# EasyEDA Pro project ProPrj_ai交互控制系统_2026-10-29.epro, board PCB1
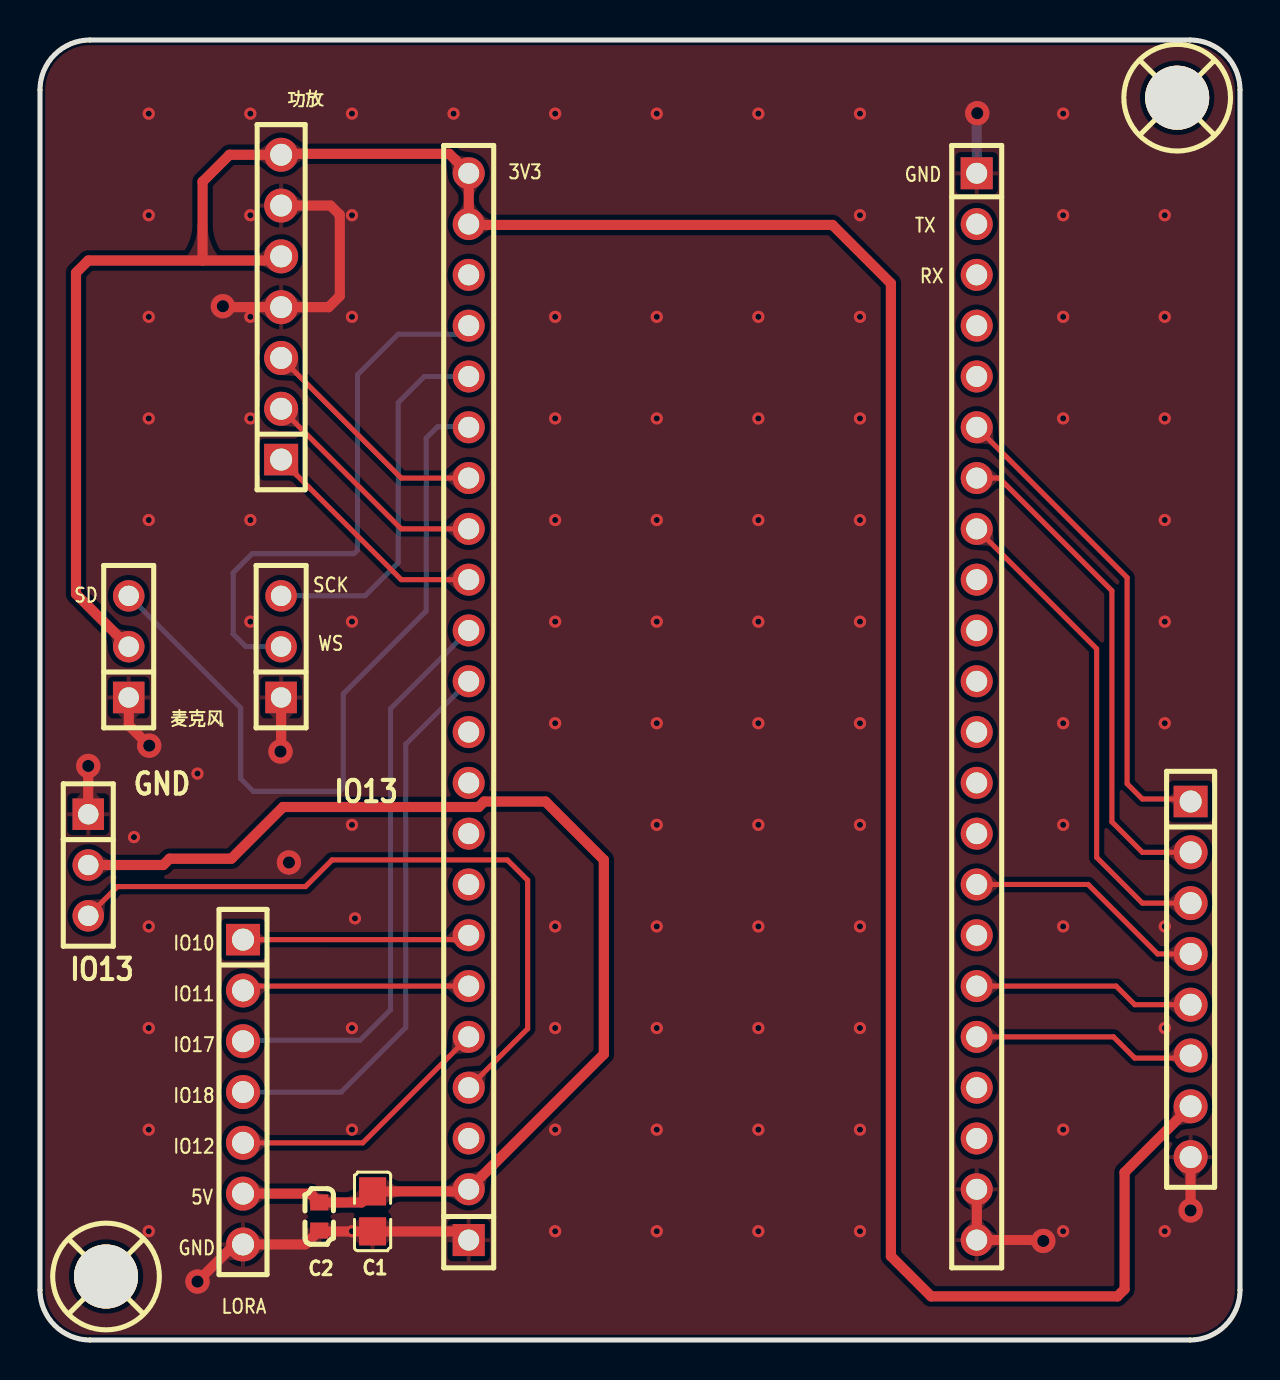
[diagram p4: board, top side]
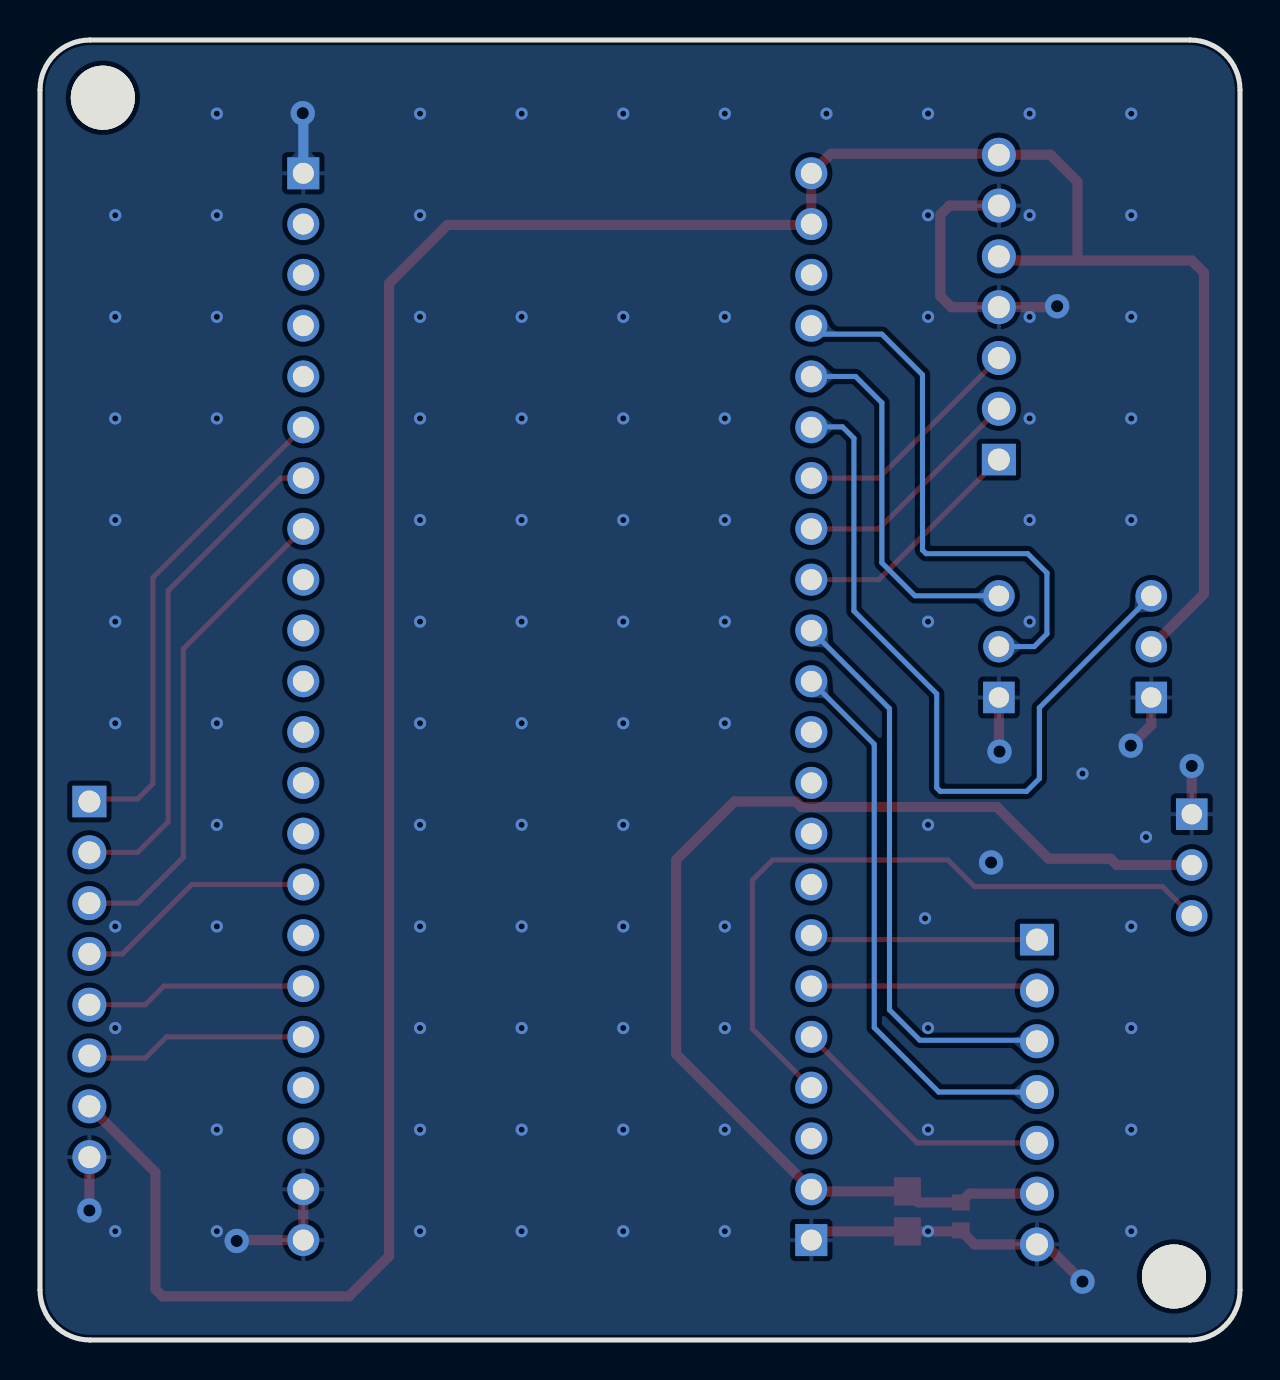
[diagram p5: board, bottom side, seen from below]

Outline 60 x 65 mm; copper layers: Top Layer, Bottom Layer. Coordinates in mm from the lower left corner of the outline.
Outline path: 0,62.5 0,2.5 arc(0.73,0.73) 2.5,0 57.5,0 arc(59.27,0.73) 60,2.5 60,62.5 arc(59.27,64.27) 57.5,65 2.5,65 arc(0.73,64.27) 0,62.5
Stack: Top Layer 0.035mm / Dielectric1 1.51mm FR4 er 4.5 / Bottom Layer 0.035mm

## Design rules (mm)
spacing copperThickness1oz (default): track to track 0.102, other pairs 0.152 to 0.3
spacing copperThickness2oz: track to track 0.203, other pairs 0.152 to 0.3
track width copperThickness1oz (default): min 0.127, default 0.254, max 2.54
track width power: min 0.203, default 0.508, max 2.54
differential pair differentialPair (default): width min 0.127, default 0.254, max 2.54; gap min 0.152, default 0.152
net GND uses copperRegion, power, viaSize1
net 3V3 uses power, viaSize1
net 5V uses power, viaSize1

## Placement (name value [footprint] x y rotation side)
C1  22uF  [C0805_1]  16.63 6.43 90 top
C2  100nF  [C0603_2]  13.96 6.18 90 top
H1  PM254V-11-07-H85  [HDR-TH_7P-P2.54-V-F]  12.06 51.64 90 top
H2  PM254V-11-03-H85  [HDR-TH_3P-P2.54-V-F]  4.44 34.67 90 top
H3  PM254V-11-03-H85  [HDR-TH_3P-P2.54-V-F]  12.06 34.67 90 top
H4  PM254V-11-07-H85  [HDR-TH_7P-P2.54-V-F]  10.15 12.4 270 top
H5  PM254V-11-03-H85  [HDR-TH_3P-P2.54-V-F]  2.41 23.75 270 top
SCREW1  -  [M3螺丝]  3.3 3.18 0 top
SCREW2  -  [M3螺丝]  56.86 62.11 0 top
U1  ZX-PM2.54-1-22PY  [HDR-TH_22P-P2.54-V-F]  21.44 31.67 90 top
U2  ZX-PM2.54-1-22PY  [HDR-TH_22P-P2.54-V-F]  46.84 31.67 270 top
U3  PM254-1-08-Z-8.5  [HDR-TH_8P-P2.54-V-F]  57.53 18.03 270 top

## Footprints (pads in the part's own frame, mm; a bottom-side part is the same pattern mirrored in y, then rotated)
C0603_2
  rect 0.8x0.9 smd: 1(-0.7,0) 2(0.7,0)
C0805_1
  rect 1.41x1.35 smd: 1(-1,0) 2(1,0)
HDR-TH_3P-P2.54-V-F
  rect 1.575x1.575 hole 1.02: 1(-2.54,0)
  round 1.575 hole 1.02: 2(0,0) 3(2.54,0)
HDR-TH_7P-P2.54-V-F
  rect 1.575x1.7 hole 1.1: 1(-7.62,0)
  round 1.7 hole 1.1: 2(-5.08,0) 3(-2.54,0) 4(0,0) 5(2.54,0) 6(5.08,0) 7(7.62,0)
HDR-TH_8P-P2.54-V-F
  rect 1.575x1.7 hole 1.1: 1(-8.89,0)
  round 1.7 hole 1.1: 2(-6.35,0) 3(-3.81,0) 4(-1.27,0) 5(1.27,0) 6(3.81,0) 7(6.35,0) 8(8.89,0)
HDR-TH_22P-P2.54-V-F
  rect 1.6x1.6 hole 1.05: 1(-26.67,0)
  round 1.6 hole 1.05: 2(-24.13,0) 3(-21.59,0) 4(-19.05,0) 5(-16.51,0) 6(-13.97,0) 7(-11.43,0) 8(-8.89,0) 9(-6.35,0) 10(-3.81,0) 11(-1.27,0) 12(1.27,0) 13(3.81,0) 14(6.35,0) 15(8.89,0) 16(11.43,0) 17(13.97,0) 18(16.51,0) 19(19.05,0) 20(21.59,0) 21(24.13,0) 22(26.67,0)
M3螺丝
  round 3.2 hole 3.2: 1(0,0)

## Nets
As in the schematic.

Pads without a net: SCREW1 1; SCREW2 1

## Via types
v1: diameter 0.61, hole 0.305, Top Layer to Bottom Layer, 89 vias
v2: diameter 1.219, hole 0.61, Top Layer to Bottom Layer, 9 vias

## Routing (per net, layer and track width the routed paths; a pad name or vN(x,y) marks a point on that pad's centre or on a via; arc(x,y) is an arc through that point)
3V3: length 145.3
  Top Layer w0.508: 8.13,53.97 2.41,53.97 1.8,53.36 1.8,37.3 H2.2 ; 8.13,53.97 11.85,53.97 H1.5 ; 8.13,53.97 8.13,57.91 9.48,59.26 H1.7 12.1,59.31 20.46,59.31 U1.22 U1.21 21.48,55.75 39.62,55.75 42.54,52.83 42.54,4.19 44.56,2.18 53.87,2.18 54.23,2.54 54.23,8.38 U3.7
5V: length 59.3
  Top Layer w0.508: H5.2 6.16,23.75 6.48,24.06 9.57,24.06 12.16,26.65 21.94,26.65 22.21,26.92 25.27,26.92 28.19,24 28.19,14.3 U1.2 21.33,7.43 C1.2 16.07,6.88 C2.2 13.52,7.32 H4.6
GND: length 47.6
  Top Layer w0.508: U2.21 U2.22 50.12,5 v2(50.16,4.95) ; U1.1 21,5.43 C1.1 14.01,5.43 C2.1 13.26,4.78 H4.7 9.73,4.78 v2(7.87,2.92) ; v2(12.02,29.42) 12.06,29.45 H3.1 ; v2(9.14,51.69) 9.19,51.64 H1.4 14.43,51.64 14.99,52.2 14.99,56.26 14.53,56.72 H1.6 ; U3.8 v2(57.53,6.48) ; v2(5.46,29.72) 4.44,30.74 H2.1 ; H5.1 v2(2.41,28.7)
  Bottom Layer w0.508: v2(46.86,61.34) 46.84,61.31 U2.1
  vias: v1(4.7,25.15) v1(5.44,61.32) v1(5.44,56.24) v1(5.44,51.16) v1(5.44,46.08) v1(5.44,41) v1(5.44,20.68) v1(5.44,15.6) v1(5.44,10.52) v1(5.44,5.44) v1(7.87,28.32) v1(10.52,61.32) v1(10.52,56.24) v1(10.52,51.16) v1(10.52,46.08) v1(10.52,41) v1(10.52,35.92) v1(15.6,61.32) v1(15.6,56.24) v1(15.6,51.16) v1(15.6,35.92) v1(15.6,25.76) v1(15.6,15.6) v1(15.6,10.52) v1(15.6,5.44) v1(15.75,21.08) v1(20.68,61.32) v1(25.76,61.32) v1(25.76,51.16) v1(25.76,46.08) v1(25.76,41) v1(25.76,35.92) v1(25.76,30.84) v1(25.76,20.68) v1(25.76,15.6) v1(25.76,10.52) v1(25.76,5.44) v1(30.84,61.32) v1(30.84,51.16) v1(30.84,46.08) v1(30.84,41) v1(30.84,35.92) v1(30.84,30.84) v1(30.84,25.76) v1(30.84,20.68) v1(30.84,15.6) v1(30.84,10.52) v1(30.84,5.44) v1(35.92,61.32) v1(35.92,51.16) v1(35.92,46.08) v1(35.92,41) v1(35.92,35.92) v1(35.92,30.84) v1(35.92,25.76) v1(35.92,20.68) v1(35.92,15.6) v1(35.92,10.52) v1(35.92,5.44) v1(41,61.32) v1(41,56.24) v1(41,51.16) v1(41,46.08) v1(41,41) v1(41,35.92) v1(41,30.84) v1(41,25.76) v1(41,20.68) v1(41,15.6) v1(41,10.52) v1(41,5.44) v1(51.16,61.32) v1(51.16,56.24) v1(51.16,51.16) v1(51.16,46.08) v1(51.16,30.84) v1(51.16,25.76) v1(51.16,20.68) v1(51.16,10.52) v1(51.16,5.44) v1(56.24,56.24) v1(56.24,51.16) v1(56.24,46.08) v1(56.24,41) v1(56.24,35.92) v1(56.24,30.84) v1(56.24,20.68) v1(56.24,15.6) v1(56.24,5.44) v2(12.45,23.88)
GPIO_4: length 27.8
  Bottom Layer w0.254: U1.19 21.01,50.29 17.91,50.29 15.88,48.26 15.88,39.5 15.7,39.32 10.62,39.32 9.65,38.35 9.65,35.31 10.29,34.67 12.05,34.67 H3.2
GPIO_5: length 18.6
  Bottom Layer w0.254: U1.18 19.22,48.18 17.91,46.86 17.91,38.86 16.26,37.21 12.06,37.21 H3.3
GPIO_6: length 38.5
  Bottom Layer w0.254: U1.17 21.42,45.66 19.88,45.66 19.3,45.08 19.3,36.45 15.17,32.31 15.17,27.61 14.99,27.43 10.67,27.43 10.03,28.07 10.03,31.61 H2.3
GPIO_7: length 11.9
  Top Layer w0.254: U1.16 18.06,43.1 H1.3
GPIO_10: length 11.4
  Top Layer w0.254: U1.7 21.22,20.02 H4.1
GPIO_11: length 11.4
  Top Layer w0.254: U1.6 10.37,17.7 H4.2
GPIO_12: length 13.5
  Top Layer w0.254: H4.5 16.14,9.86 U1.5
GPIO_13: length 35.1
  Top Layer w0.254: H5.3 3.87,22.67 13.27,22.67 14.6,24 23.37,24 24.38,22.99 24.38,15.56 U1.4
GPIO_15: length 11.9
  Top Layer w0.254: U1.15 18.06,40.56 H1.2
GPIO_16: length 11.9
  Top Layer w0.254: H1.1 18.06,38.02 U1.14
GPIO_17: length 28.6
  Bottom Layer w0.254: U1.13 17.53,31.57 17.53,16.51 16,14.99 10.2,14.99 H4.3
GPIO_18: length 28.1
  Bottom Layer w0.254: U1.12 18.29,29.79 18.29,15.62 15.07,12.4 H4.4
GPIO_21: length 11.2
  Top Layer w0.254: U3.6 57.4,14.1 54.74,14.1 53.68,15.16 U2.18
GPIO_40: length 24.6
  Top Layer w0.254: U2.8 52.83,34.56 52.83,24.13 55.12,21.84 U3.3
GPIO_41: length 25.2
  Top Layer w0.254: U2.7 47.96,43.1 53.59,37.47 53.59,25.91 55.12,24.38 U3.2
GPIO_42: length 24.5
  Top Layer w0.254: U3.1 57.4,27.05 55.12,27.05 54.36,27.81 54.36,38.12 U2.6
GPIO_45: length 12.1
  Top Layer w0.254: U2.15 52.41,22.78 55.88,19.3 U3.4
GPIO_47: length 11.1
  Top Layer w0.254: U3.5 54.74,16.76 53.8,17.7 U2.17

## Copper pours and planes (outline as drawn; the poured copper is in the pictures)
GND on Top Layer: -4.06,67.18 66.04,67.18 66.04,-3.68 -4.06,-3.68
GND on Bottom Layer: -8.64,69.98 70.74,69.98 70.74,-7.75 -8.64,-7.75

Small or netless copper shapes (teardrops, artwork), in the pictures only: 70 on Top Layer, 12 on Bottom Layer

## Text on the board
Top Silkscreen Layer: SD | IO10 | IO11 | IO17 | IO18 | IO12 | GND | 5V | LORA | SCK | WS | 3V3 | TX | RX | IO13 | 麦克风 | 功放
